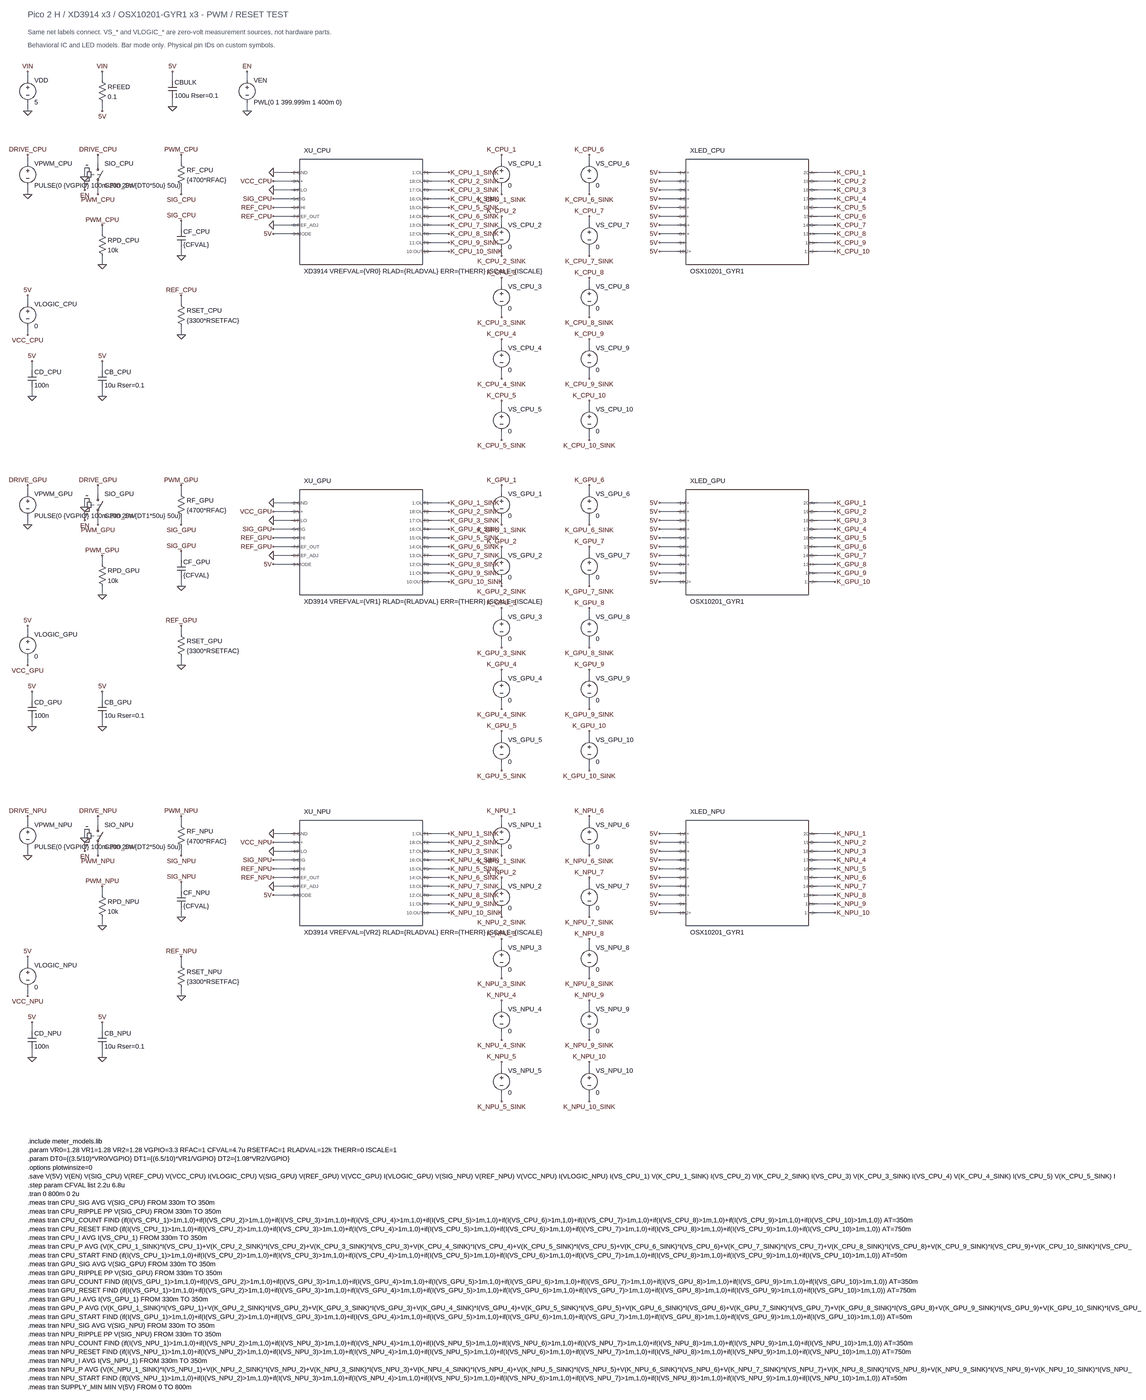
[diagram p0: schematic level_meter.asc, whole sheet]
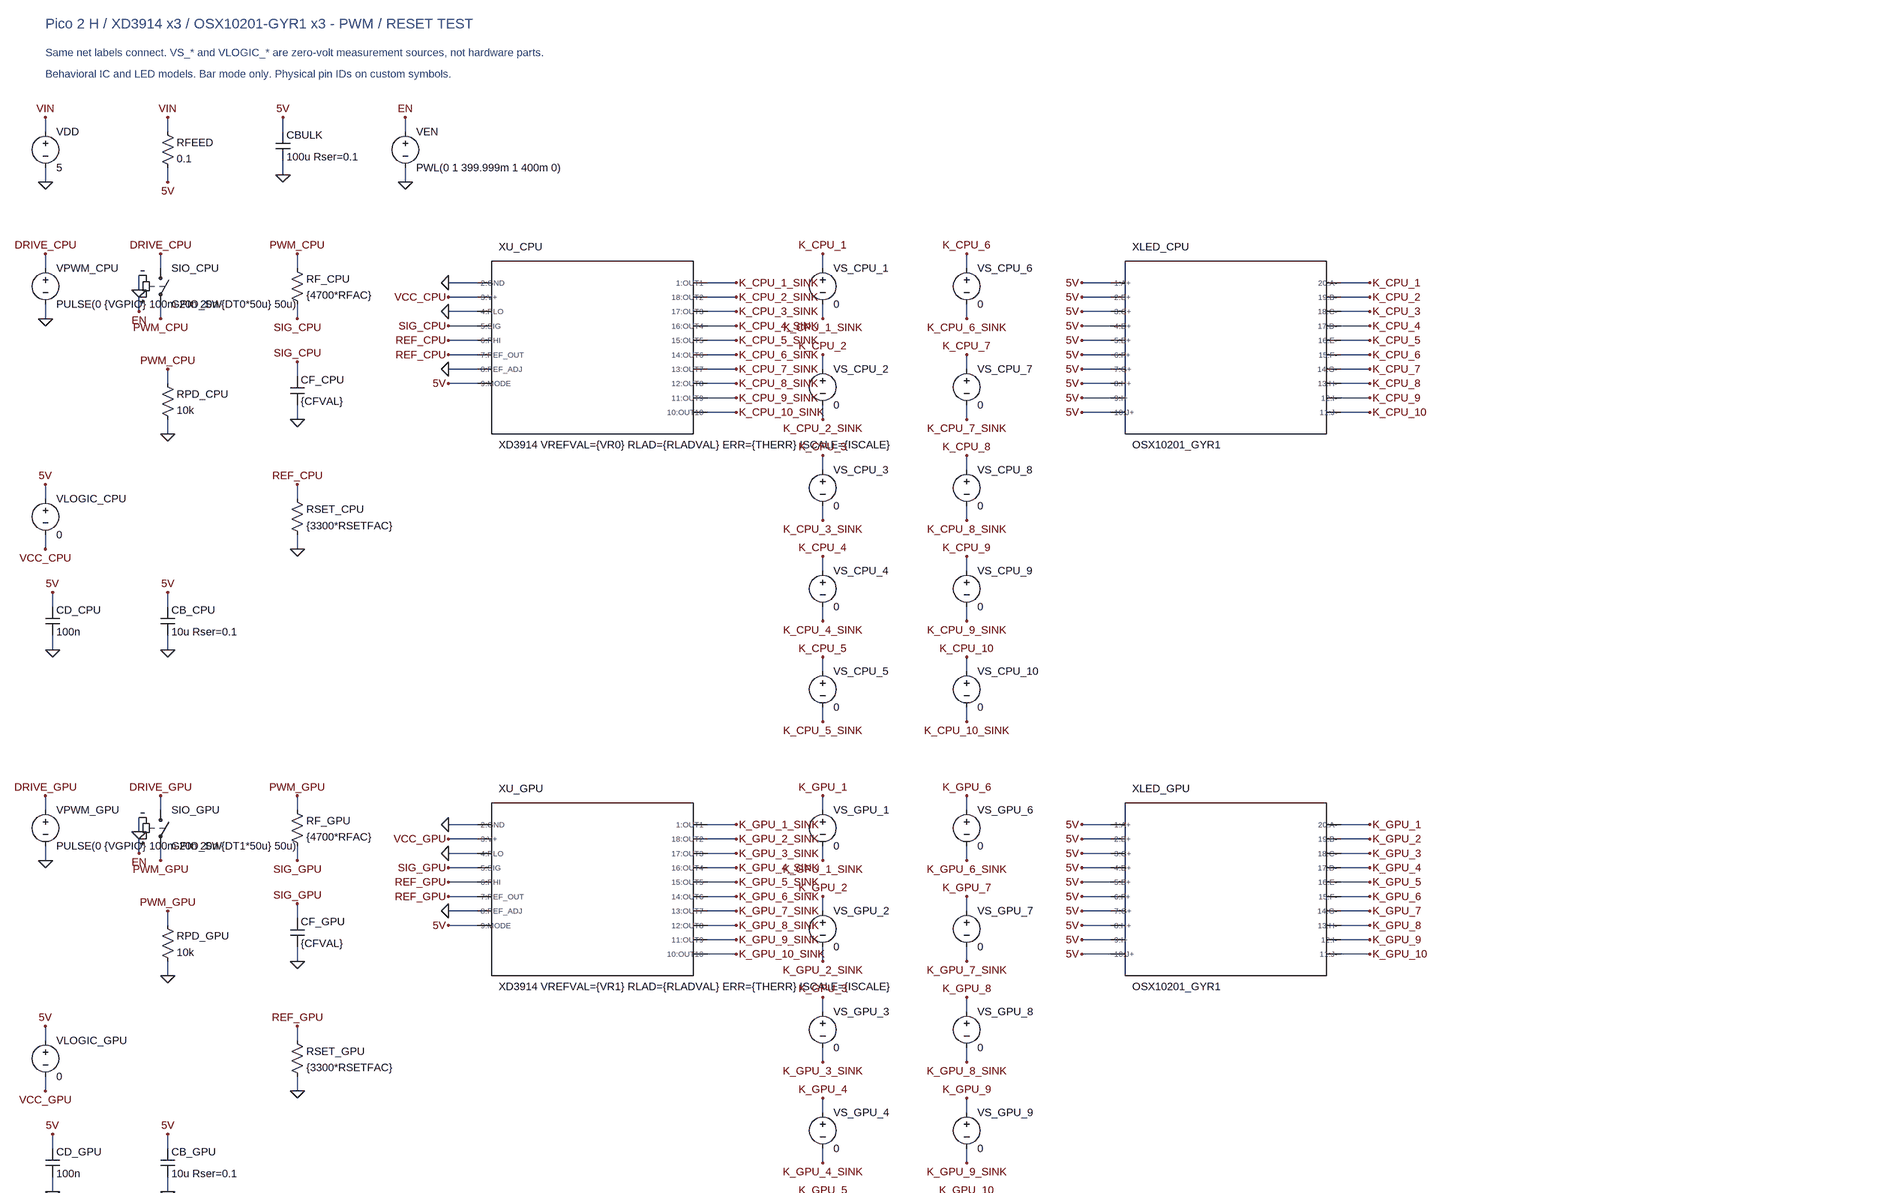
[diagram p1: schematic level_meter.asc, part, row 1 of 2, column 1 of 1]
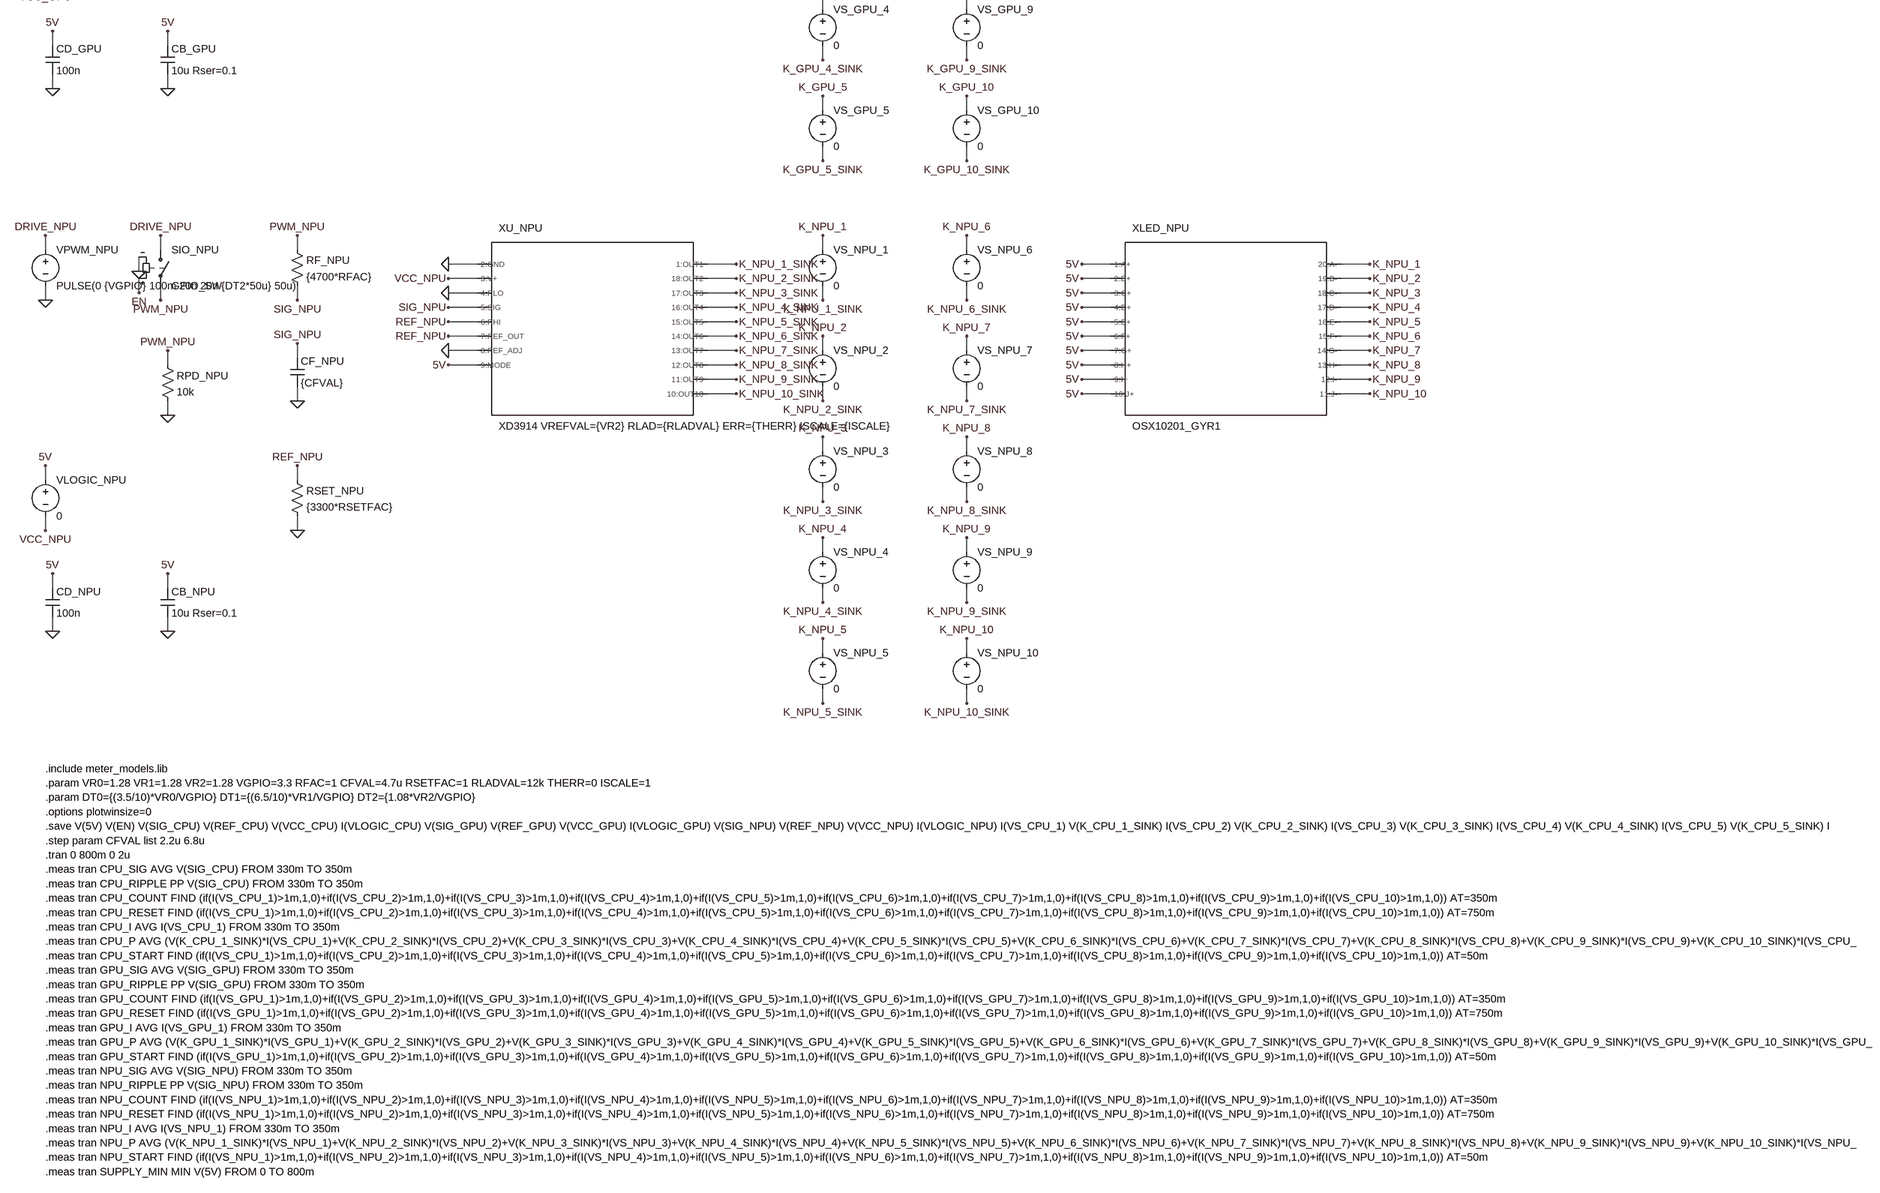
[diagram p2: schematic level_meter.asc, part, row 2 of 2, column 1 of 1]
level_meter.asc, the LTspice schematic file:
Version 4.1
SHEET 1 3500 7000
TEXT 64 -96 Left 3 ;Pico 2 H / XD3914 x3 / OSX10201-GYR1 x3 - PWM / RESET TEST
TEXT 64 -32 Left 2 ;Same net labels connect. VS_* and VLOGIC_* are zero-volt measurement sources, not hardware parts.
TEXT 64 16 Left 2 ;Behavioral IC and LED models. Bar mode only. Physical pin IDs on custom symbols.
WIRE 64 144 64 112
FLAG 64 112 VIN
WIRE 64 224 64 256
FLAG 64 256 0
WIRE 336 144 336 112
FLAG 336 112 VIN
WIRE 336 224 336 256
FLAG 336 256 5V
WIRE 592 144 592 112
FLAG 592 112 5V
WIRE 592 208 592 240
FLAG 592 240 0
WIRE 64 656 64 624
FLAG 64 624 DRIVE_CPU
WIRE 64 736 64 768
FLAG 64 768 0
WIRE 320 656 320 624
FLAG 320 624 DRIVE_CPU
WIRE 320 736 320 768
FLAG 320 768 PWM_CPU
WIRE 272 720 272 752
FLAG 272 752 EN
WIRE 272 672 272 704
FLAG 272 704 0
WIRE 336 912 336 880
FLAG 336 880 PWM_CPU
WIRE 336 992 336 1024
FLAG 336 1024 0
WIRE 624 656 624 624
FLAG 624 624 PWM_CPU
WIRE 624 736 624 768
FLAG 624 768 SIG_CPU
WIRE 624 896 624 864
FLAG 624 864 SIG_CPU
WIRE 624 960 624 992
FLAG 624 992 0
WIRE 1536 688 1600 688
FLAG 1600 688 K_CPU_1_SINK
WIRE 1024 688 960 688
FLAG 960 688 0
WIRE 1024 720 960 720
FLAG 960 720 VCC_CPU
WIRE 1024 752 960 752
FLAG 960 752 0
WIRE 1024 784 960 784
FLAG 960 784 SIG_CPU
WIRE 1024 816 960 816
FLAG 960 816 REF_CPU
WIRE 1024 848 960 848
FLAG 960 848 REF_CPU
WIRE 1024 880 960 880
FLAG 960 880 0
WIRE 1024 912 960 912
FLAG 960 912 5V
WIRE 1536 976 1600 976
FLAG 1600 976 K_CPU_10_SINK
WIRE 1536 944 1600 944
FLAG 1600 944 K_CPU_9_SINK
WIRE 1536 912 1600 912
FLAG 1600 912 K_CPU_8_SINK
WIRE 1536 880 1600 880
FLAG 1600 880 K_CPU_7_SINK
WIRE 1536 848 1600 848
FLAG 1600 848 K_CPU_6_SINK
WIRE 1536 816 1600 816
FLAG 1600 816 K_CPU_5_SINK
WIRE 1536 784 1600 784
FLAG 1600 784 K_CPU_4_SINK
WIRE 1536 752 1600 752
FLAG 1600 752 K_CPU_3_SINK
WIRE 1536 720 1600 720
FLAG 1600 720 K_CPU_2_SINK
WIRE 64 1168 64 1136
FLAG 64 1136 5V
WIRE 64 1248 64 1280
FLAG 64 1280 VCC_CPU
WIRE 624 1168 624 1136
FLAG 624 1136 REF_CPU
WIRE 624 1248 624 1280
FLAG 624 1280 0
WIRE 80 1408 80 1376
FLAG 80 1376 5V
WIRE 80 1472 80 1504
FLAG 80 1504 0
WIRE 336 1408 336 1376
FLAG 336 1376 5V
WIRE 336 1472 336 1504
FLAG 336 1504 0
WIRE 2432 688 2368 688
FLAG 2368 688 5V
WIRE 2432 720 2368 720
FLAG 2368 720 5V
WIRE 2432 752 2368 752
FLAG 2368 752 5V
WIRE 2432 784 2368 784
FLAG 2368 784 5V
WIRE 2432 816 2368 816
FLAG 2368 816 5V
WIRE 2432 848 2368 848
FLAG 2368 848 5V
WIRE 2432 880 2368 880
FLAG 2368 880 5V
WIRE 2432 912 2368 912
FLAG 2368 912 5V
WIRE 2432 944 2368 944
FLAG 2368 944 5V
WIRE 2432 976 2368 976
FLAG 2368 976 5V
WIRE 2944 976 3008 976
FLAG 3008 976 K_CPU_10
WIRE 2944 944 3008 944
FLAG 3008 944 K_CPU_9
WIRE 2944 912 3008 912
FLAG 3008 912 K_CPU_8
WIRE 2944 880 3008 880
FLAG 3008 880 K_CPU_7
WIRE 2944 848 3008 848
FLAG 3008 848 K_CPU_6
WIRE 2944 816 3008 816
FLAG 3008 816 K_CPU_5
WIRE 2944 784 3008 784
FLAG 3008 784 K_CPU_4
WIRE 2944 752 3008 752
FLAG 3008 752 K_CPU_3
WIRE 2944 720 3008 720
FLAG 3008 720 K_CPU_2
WIRE 2944 688 3008 688
FLAG 3008 688 K_CPU_1
WIRE 1792 656 1792 624
FLAG 1792 624 K_CPU_1
WIRE 1792 736 1792 768
FLAG 1792 768 K_CPU_1_SINK
WIRE 1792 880 1792 848
FLAG 1792 848 K_CPU_2
WIRE 1792 960 1792 992
FLAG 1792 992 K_CPU_2_SINK
WIRE 1792 1104 1792 1072
FLAG 1792 1072 K_CPU_3
WIRE 1792 1184 1792 1216
FLAG 1792 1216 K_CPU_3_SINK
WIRE 1792 1328 1792 1296
FLAG 1792 1296 K_CPU_4
WIRE 1792 1408 1792 1440
FLAG 1792 1440 K_CPU_4_SINK
WIRE 1792 1552 1792 1520
FLAG 1792 1520 K_CPU_5
WIRE 1792 1632 1792 1664
FLAG 1792 1664 K_CPU_5_SINK
WIRE 2112 656 2112 624
FLAG 2112 624 K_CPU_6
WIRE 2112 736 2112 768
FLAG 2112 768 K_CPU_6_SINK
WIRE 2112 880 2112 848
FLAG 2112 848 K_CPU_7
WIRE 2112 960 2112 992
FLAG 2112 992 K_CPU_7_SINK
WIRE 2112 1104 2112 1072
FLAG 2112 1072 K_CPU_8
WIRE 2112 1184 2112 1216
FLAG 2112 1216 K_CPU_8_SINK
WIRE 2112 1328 2112 1296
FLAG 2112 1296 K_CPU_9
WIRE 2112 1408 2112 1440
FLAG 2112 1440 K_CPU_9_SINK
WIRE 2112 1552 2112 1520
FLAG 2112 1520 K_CPU_10
WIRE 2112 1632 2112 1664
FLAG 2112 1664 K_CPU_10_SINK
WIRE 64 2192 64 2160
FLAG 64 2160 DRIVE_GPU
WIRE 64 2272 64 2304
FLAG 64 2304 0
WIRE 320 2192 320 2160
FLAG 320 2160 DRIVE_GPU
WIRE 320 2272 320 2304
FLAG 320 2304 PWM_GPU
WIRE 272 2256 272 2288
FLAG 272 2288 EN
WIRE 272 2208 272 2240
FLAG 272 2240 0
WIRE 336 2448 336 2416
FLAG 336 2416 PWM_GPU
WIRE 336 2528 336 2560
FLAG 336 2560 0
WIRE 624 2192 624 2160
FLAG 624 2160 PWM_GPU
WIRE 624 2272 624 2304
FLAG 624 2304 SIG_GPU
WIRE 624 2432 624 2400
FLAG 624 2400 SIG_GPU
WIRE 624 2496 624 2528
FLAG 624 2528 0
WIRE 1536 2224 1600 2224
FLAG 1600 2224 K_GPU_1_SINK
WIRE 1024 2224 960 2224
FLAG 960 2224 0
WIRE 1024 2256 960 2256
FLAG 960 2256 VCC_GPU
WIRE 1024 2288 960 2288
FLAG 960 2288 0
WIRE 1024 2320 960 2320
FLAG 960 2320 SIG_GPU
WIRE 1024 2352 960 2352
FLAG 960 2352 REF_GPU
WIRE 1024 2384 960 2384
FLAG 960 2384 REF_GPU
WIRE 1024 2416 960 2416
FLAG 960 2416 0
WIRE 1024 2448 960 2448
FLAG 960 2448 5V
WIRE 1536 2512 1600 2512
FLAG 1600 2512 K_GPU_10_SINK
WIRE 1536 2480 1600 2480
FLAG 1600 2480 K_GPU_9_SINK
WIRE 1536 2448 1600 2448
FLAG 1600 2448 K_GPU_8_SINK
WIRE 1536 2416 1600 2416
FLAG 1600 2416 K_GPU_7_SINK
WIRE 1536 2384 1600 2384
FLAG 1600 2384 K_GPU_6_SINK
WIRE 1536 2352 1600 2352
FLAG 1600 2352 K_GPU_5_SINK
WIRE 1536 2320 1600 2320
FLAG 1600 2320 K_GPU_4_SINK
WIRE 1536 2288 1600 2288
FLAG 1600 2288 K_GPU_3_SINK
WIRE 1536 2256 1600 2256
FLAG 1600 2256 K_GPU_2_SINK
WIRE 64 2704 64 2672
FLAG 64 2672 5V
WIRE 64 2784 64 2816
FLAG 64 2816 VCC_GPU
WIRE 624 2704 624 2672
FLAG 624 2672 REF_GPU
WIRE 624 2784 624 2816
FLAG 624 2816 0
WIRE 80 2944 80 2912
FLAG 80 2912 5V
WIRE 80 3008 80 3040
FLAG 80 3040 0
WIRE 336 2944 336 2912
FLAG 336 2912 5V
WIRE 336 3008 336 3040
FLAG 336 3040 0
WIRE 2432 2224 2368 2224
FLAG 2368 2224 5V
WIRE 2432 2256 2368 2256
FLAG 2368 2256 5V
WIRE 2432 2288 2368 2288
FLAG 2368 2288 5V
WIRE 2432 2320 2368 2320
FLAG 2368 2320 5V
WIRE 2432 2352 2368 2352
FLAG 2368 2352 5V
WIRE 2432 2384 2368 2384
FLAG 2368 2384 5V
WIRE 2432 2416 2368 2416
FLAG 2368 2416 5V
WIRE 2432 2448 2368 2448
FLAG 2368 2448 5V
WIRE 2432 2480 2368 2480
FLAG 2368 2480 5V
WIRE 2432 2512 2368 2512
FLAG 2368 2512 5V
WIRE 2944 2512 3008 2512
FLAG 3008 2512 K_GPU_10
WIRE 2944 2480 3008 2480
FLAG 3008 2480 K_GPU_9
WIRE 2944 2448 3008 2448
FLAG 3008 2448 K_GPU_8
WIRE 2944 2416 3008 2416
FLAG 3008 2416 K_GPU_7
WIRE 2944 2384 3008 2384
FLAG 3008 2384 K_GPU_6
WIRE 2944 2352 3008 2352
FLAG 3008 2352 K_GPU_5
WIRE 2944 2320 3008 2320
FLAG 3008 2320 K_GPU_4
WIRE 2944 2288 3008 2288
FLAG 3008 2288 K_GPU_3
WIRE 2944 2256 3008 2256
FLAG 3008 2256 K_GPU_2
WIRE 2944 2224 3008 2224
FLAG 3008 2224 K_GPU_1
WIRE 1792 2192 1792 2160
FLAG 1792 2160 K_GPU_1
WIRE 1792 2272 1792 2304
FLAG 1792 2304 K_GPU_1_SINK
WIRE 1792 2416 1792 2384
FLAG 1792 2384 K_GPU_2
WIRE 1792 2496 1792 2528
FLAG 1792 2528 K_GPU_2_SINK
WIRE 1792 2640 1792 2608
FLAG 1792 2608 K_GPU_3
WIRE 1792 2720 1792 2752
FLAG 1792 2752 K_GPU_3_SINK
WIRE 1792 2864 1792 2832
FLAG 1792 2832 K_GPU_4
WIRE 1792 2944 1792 2976
FLAG 1792 2976 K_GPU_4_SINK
WIRE 1792 3088 1792 3056
FLAG 1792 3056 K_GPU_5
WIRE 1792 3168 1792 3200
FLAG 1792 3200 K_GPU_5_SINK
WIRE 2112 2192 2112 2160
FLAG 2112 2160 K_GPU_6
WIRE 2112 2272 2112 2304
FLAG 2112 2304 K_GPU_6_SINK
WIRE 2112 2416 2112 2384
FLAG 2112 2384 K_GPU_7
WIRE 2112 2496 2112 2528
FLAG 2112 2528 K_GPU_7_SINK
WIRE 2112 2640 2112 2608
FLAG 2112 2608 K_GPU_8
WIRE 2112 2720 2112 2752
FLAG 2112 2752 K_GPU_8_SINK
WIRE 2112 2864 2112 2832
FLAG 2112 2832 K_GPU_9
WIRE 2112 2944 2112 2976
FLAG 2112 2976 K_GPU_9_SINK
WIRE 2112 3088 2112 3056
FLAG 2112 3056 K_GPU_10
WIRE 2112 3168 2112 3200
FLAG 2112 3200 K_GPU_10_SINK
WIRE 64 3728 64 3696
FLAG 64 3696 DRIVE_NPU
WIRE 64 3808 64 3840
FLAG 64 3840 0
WIRE 320 3728 320 3696
FLAG 320 3696 DRIVE_NPU
WIRE 320 3808 320 3840
FLAG 320 3840 PWM_NPU
WIRE 272 3792 272 3824
FLAG 272 3824 EN
WIRE 272 3744 272 3776
FLAG 272 3776 0
WIRE 336 3984 336 3952
FLAG 336 3952 PWM_NPU
WIRE 336 4064 336 4096
FLAG 336 4096 0
WIRE 624 3728 624 3696
FLAG 624 3696 PWM_NPU
WIRE 624 3808 624 3840
FLAG 624 3840 SIG_NPU
WIRE 624 3968 624 3936
FLAG 624 3936 SIG_NPU
WIRE 624 4032 624 4064
FLAG 624 4064 0
WIRE 1536 3760 1600 3760
FLAG 1600 3760 K_NPU_1_SINK
WIRE 1024 3760 960 3760
FLAG 960 3760 0
WIRE 1024 3792 960 3792
FLAG 960 3792 VCC_NPU
WIRE 1024 3824 960 3824
FLAG 960 3824 0
WIRE 1024 3856 960 3856
FLAG 960 3856 SIG_NPU
WIRE 1024 3888 960 3888
FLAG 960 3888 REF_NPU
WIRE 1024 3920 960 3920
FLAG 960 3920 REF_NPU
WIRE 1024 3952 960 3952
FLAG 960 3952 0
WIRE 1024 3984 960 3984
FLAG 960 3984 5V
WIRE 1536 4048 1600 4048
FLAG 1600 4048 K_NPU_10_SINK
WIRE 1536 4016 1600 4016
FLAG 1600 4016 K_NPU_9_SINK
WIRE 1536 3984 1600 3984
FLAG 1600 3984 K_NPU_8_SINK
WIRE 1536 3952 1600 3952
FLAG 1600 3952 K_NPU_7_SINK
WIRE 1536 3920 1600 3920
FLAG 1600 3920 K_NPU_6_SINK
WIRE 1536 3888 1600 3888
FLAG 1600 3888 K_NPU_5_SINK
WIRE 1536 3856 1600 3856
FLAG 1600 3856 K_NPU_4_SINK
WIRE 1536 3824 1600 3824
FLAG 1600 3824 K_NPU_3_SINK
WIRE 1536 3792 1600 3792
FLAG 1600 3792 K_NPU_2_SINK
WIRE 64 4240 64 4208
FLAG 64 4208 5V
WIRE 64 4320 64 4352
FLAG 64 4352 VCC_NPU
WIRE 624 4240 624 4208
FLAG 624 4208 REF_NPU
WIRE 624 4320 624 4352
FLAG 624 4352 0
WIRE 80 4480 80 4448
FLAG 80 4448 5V
WIRE 80 4544 80 4576
FLAG 80 4576 0
WIRE 336 4480 336 4448
FLAG 336 4448 5V
WIRE 336 4544 336 4576
FLAG 336 4576 0
WIRE 2432 3760 2368 3760
FLAG 2368 3760 5V
WIRE 2432 3792 2368 3792
FLAG 2368 3792 5V
WIRE 2432 3824 2368 3824
FLAG 2368 3824 5V
WIRE 2432 3856 2368 3856
FLAG 2368 3856 5V
WIRE 2432 3888 2368 3888
FLAG 2368 3888 5V
WIRE 2432 3920 2368 3920
FLAG 2368 3920 5V
WIRE 2432 3952 2368 3952
FLAG 2368 3952 5V
WIRE 2432 3984 2368 3984
FLAG 2368 3984 5V
WIRE 2432 4016 2368 4016
FLAG 2368 4016 5V
WIRE 2432 4048 2368 4048
FLAG 2368 4048 5V
WIRE 2944 4048 3008 4048
FLAG 3008 4048 K_NPU_10
WIRE 2944 4016 3008 4016
FLAG 3008 4016 K_NPU_9
WIRE 2944 3984 3008 3984
FLAG 3008 3984 K_NPU_8
WIRE 2944 3952 3008 3952
FLAG 3008 3952 K_NPU_7
WIRE 2944 3920 3008 3920
FLAG 3008 3920 K_NPU_6
WIRE 2944 3888 3008 3888
FLAG 3008 3888 K_NPU_5
WIRE 2944 3856 3008 3856
FLAG 3008 3856 K_NPU_4
WIRE 2944 3824 3008 3824
FLAG 3008 3824 K_NPU_3
WIRE 2944 3792 3008 3792
FLAG 3008 3792 K_NPU_2
WIRE 2944 3760 3008 3760
FLAG 3008 3760 K_NPU_1
WIRE 1792 3728 1792 3696
FLAG 1792 3696 K_NPU_1
WIRE 1792 3808 1792 3840
FLAG 1792 3840 K_NPU_1_SINK
WIRE 1792 3952 1792 3920
FLAG 1792 3920 K_NPU_2
WIRE 1792 4032 1792 4064
FLAG 1792 4064 K_NPU_2_SINK
WIRE 1792 4176 1792 4144
FLAG 1792 4144 K_NPU_3
WIRE 1792 4256 1792 4288
FLAG 1792 4288 K_NPU_3_SINK
WIRE 1792 4400 1792 4368
FLAG 1792 4368 K_NPU_4
WIRE 1792 4480 1792 4512
FLAG 1792 4512 K_NPU_4_SINK
WIRE 1792 4624 1792 4592
FLAG 1792 4592 K_NPU_5
WIRE 1792 4704 1792 4736
FLAG 1792 4736 K_NPU_5_SINK
WIRE 2112 3728 2112 3696
FLAG 2112 3696 K_NPU_6
WIRE 2112 3808 2112 3840
FLAG 2112 3840 K_NPU_6_SINK
WIRE 2112 3952 2112 3920
FLAG 2112 3920 K_NPU_7
WIRE 2112 4032 2112 4064
FLAG 2112 4064 K_NPU_7_SINK
WIRE 2112 4176 2112 4144
FLAG 2112 4144 K_NPU_8
WIRE 2112 4256 2112 4288
FLAG 2112 4288 K_NPU_8_SINK
WIRE 2112 4400 2112 4368
FLAG 2112 4368 K_NPU_9
WIRE 2112 4480 2112 4512
FLAG 2112 4512 K_NPU_9_SINK
WIRE 2112 4624 2112 4592
FLAG 2112 4592 K_NPU_10
WIRE 2112 4704 2112 4736
FLAG 2112 4736 K_NPU_10_SINK
WIRE 864 144 864 112
FLAG 864 112 EN
WIRE 864 224 864 256
FLAG 864 256 0
SYMBOL voltage 64 128 R0
SYMATTR InstName VDD
SYMATTR Value 5
SYMBOL res 320 128 R0
SYMATTR InstName RFEED
SYMATTR Value 0.1
SYMBOL cap 576 144 R0
SYMATTR InstName CBULK
SYMATTR Value 100u Rser=0.1
SYMBOL voltage 64 640 R0
SYMATTR InstName VPWM_CPU
SYMATTR Value PULSE(0 {VGPIO} 100m 20n 20n {DT0*50u} 50u)
SYMBOL sw 320 640 R0
SYMATTR InstName SIO_CPU
SYMATTR Value GPIO_SW
SYMBOL res 320 896 R0
SYMATTR InstName RPD_CPU
SYMATTR Value 10k
SYMBOL res 608 640 R0
SYMATTR InstName RF_CPU
SYMATTR Value {4700*RFAC}
SYMBOL cap 608 896 R0
SYMATTR InstName CF_CPU
SYMATTR Value {CFVAL}
SYMBOL XD3914 1024 640 R0
SYMATTR InstName XU_CPU
SYMATTR Value XD3914 VREFVAL={VR0} RLAD={RLADVAL} ERR={THERR} ISCALE={ISCALE}
SYMBOL voltage 64 1152 R0
SYMATTR InstName VLOGIC_CPU
SYMATTR Value 0
SYMBOL res 608 1152 R0
SYMATTR InstName RSET_CPU
SYMATTR Value {3300*RSETFAC}
SYMBOL cap 64 1408 R0
SYMATTR InstName CD_CPU
SYMATTR Value 100n
SYMBOL cap 320 1408 R0
SYMATTR InstName CB_CPU
SYMATTR Value 10u Rser=0.1
SYMBOL OSX10201_GYR1 2432 640 R0
SYMATTR InstName XLED_CPU
SYMATTR Value OSX10201_GYR1
SYMBOL voltage 1792 640 R0
SYMATTR InstName VS_CPU_1
SYMATTR Value 0
SYMBOL voltage 1792 864 R0
SYMATTR InstName VS_CPU_2
SYMATTR Value 0
SYMBOL voltage 1792 1088 R0
SYMATTR InstName VS_CPU_3
SYMATTR Value 0
SYMBOL voltage 1792 1312 R0
SYMATTR InstName VS_CPU_4
SYMATTR Value 0
SYMBOL voltage 1792 1536 R0
SYMATTR InstName VS_CPU_5
SYMATTR Value 0
SYMBOL voltage 2112 640 R0
SYMATTR InstName VS_CPU_6
SYMATTR Value 0
SYMBOL voltage 2112 864 R0
SYMATTR InstName VS_CPU_7
SYMATTR Value 0
SYMBOL voltage 2112 1088 R0
SYMATTR InstName VS_CPU_8
SYMATTR Value 0
SYMBOL voltage 2112 1312 R0
SYMATTR InstName VS_CPU_9
SYMATTR Value 0
SYMBOL voltage 2112 1536 R0
SYMATTR InstName VS_CPU_10
SYMATTR Value 0
SYMBOL voltage 64 2176 R0
SYMATTR InstName VPWM_GPU
SYMATTR Value PULSE(0 {VGPIO} 100m 20n 20n {DT1*50u} 50u)
SYMBOL sw 320 2176 R0
SYMATTR InstName SIO_GPU
SYMATTR Value GPIO_SW
SYMBOL res 320 2432 R0
SYMATTR InstName RPD_GPU
SYMATTR Value 10k
SYMBOL res 608 2176 R0
SYMATTR InstName RF_GPU
SYMATTR Value {4700*RFAC}
SYMBOL cap 608 2432 R0
SYMATTR InstName CF_GPU
SYMATTR Value {CFVAL}
SYMBOL XD3914 1024 2176 R0
SYMATTR InstName XU_GPU
SYMATTR Value XD3914 VREFVAL={VR1} RLAD={RLADVAL} ERR={THERR} ISCALE={ISCALE}
SYMBOL voltage 64 2688 R0
SYMATTR InstName VLOGIC_GPU
SYMATTR Value 0
SYMBOL res 608 2688 R0
SYMATTR InstName RSET_GPU
SYMATTR Value {3300*RSETFAC}
SYMBOL cap 64 2944 R0
SYMATTR InstName CD_GPU
SYMATTR Value 100n
SYMBOL cap 320 2944 R0
SYMATTR InstName CB_GPU
SYMATTR Value 10u Rser=0.1
SYMBOL OSX10201_GYR1 2432 2176 R0
SYMATTR InstName XLED_GPU
SYMATTR Value OSX10201_GYR1
SYMBOL voltage 1792 2176 R0
SYMATTR InstName VS_GPU_1
SYMATTR Value 0
SYMBOL voltage 1792 2400 R0
SYMATTR InstName VS_GPU_2
SYMATTR Value 0
SYMBOL voltage 1792 2624 R0
SYMATTR InstName VS_GPU_3
SYMATTR Value 0
SYMBOL voltage 1792 2848 R0
SYMATTR InstName VS_GPU_4
SYMATTR Value 0
SYMBOL voltage 1792 3072 R0
SYMATTR InstName VS_GPU_5
SYMATTR Value 0
SYMBOL voltage 2112 2176 R0
SYMATTR InstName VS_GPU_6
SYMATTR Value 0
SYMBOL voltage 2112 2400 R0
SYMATTR InstName VS_GPU_7
SYMATTR Value 0
SYMBOL voltage 2112 2624 R0
SYMATTR InstName VS_GPU_8
SYMATTR Value 0
SYMBOL voltage 2112 2848 R0
SYMATTR InstName VS_GPU_9
SYMATTR Value 0
SYMBOL voltage 2112 3072 R0
SYMATTR InstName VS_GPU_10
SYMATTR Value 0
SYMBOL voltage 64 3712 R0
SYMATTR InstName VPWM_NPU
SYMATTR Value PULSE(0 {VGPIO} 100m 20n 20n {DT2*50u} 50u)
SYMBOL sw 320 3712 R0
SYMATTR InstName SIO_NPU
SYMATTR Value GPIO_SW
SYMBOL res 320 3968 R0
SYMATTR InstName RPD_NPU
SYMATTR Value 10k
SYMBOL res 608 3712 R0
SYMATTR InstName RF_NPU
SYMATTR Value {4700*RFAC}
SYMBOL cap 608 3968 R0
SYMATTR InstName CF_NPU
SYMATTR Value {CFVAL}
SYMBOL XD3914 1024 3712 R0
SYMATTR InstName XU_NPU
SYMATTR Value XD3914 VREFVAL={VR2} RLAD={RLADVAL} ERR={THERR} ISCALE={ISCALE}
SYMBOL voltage 64 4224 R0
SYMATTR InstName VLOGIC_NPU
SYMATTR Value 0
SYMBOL res 608 4224 R0
SYMATTR InstName RSET_NPU
SYMATTR Value {3300*RSETFAC}
SYMBOL cap 64 4480 R0
SYMATTR InstName CD_NPU
SYMATTR Value 100n
SYMBOL cap 320 4480 R0
SYMATTR InstName CB_NPU
SYMATTR Value 10u Rser=0.1
SYMBOL OSX10201_GYR1 2432 3712 R0
SYMATTR InstName XLED_NPU
SYMATTR Value OSX10201_GYR1
SYMBOL voltage 1792 3712 R0
SYMATTR InstName VS_NPU_1
SYMATTR Value 0
SYMBOL voltage 1792 3936 R0
SYMATTR InstName VS_NPU_2
SYMATTR Value 0
SYMBOL voltage 1792 4160 R0
SYMATTR InstName VS_NPU_3
SYMATTR Value 0
SYMBOL voltage 1792 4384 R0
SYMATTR InstName VS_NPU_4
SYMATTR Value 0
SYMBOL voltage 1792 4608 R0
SYMATTR InstName VS_NPU_5
SYMATTR Value 0
SYMBOL voltage 2112 3712 R0
SYMATTR InstName VS_NPU_6
SYMATTR Value 0
SYMBOL voltage 2112 3936 R0
SYMATTR InstName VS_NPU_7
SYMATTR Value 0
SYMBOL voltage 2112 4160 R0
SYMATTR InstName VS_NPU_8
SYMATTR Value 0
SYMBOL voltage 2112 4384 R0
SYMATTR InstName VS_NPU_9
SYMATTR Value 0
SYMBOL voltage 2112 4608 R0
SYMATTR InstName VS_NPU_10
SYMATTR Value 0
SYMBOL voltage 864 128 R0
SYMATTR InstName VEN
SYMATTR Value PWL(0 1 399.999m 1 400m 0)
TEXT 64 5408 Left 2 !.include meter_models.lib
TEXT 64 5440 Left 2 !.param VR0=1.28 VR1=1.28 VR2=1.28 VGPIO=3.3 RFAC=1 CFVAL=4.7u RSETFAC=1 RLADVAL=12k THERR=0 ISCALE=1
TEXT 64 5472 Left 2 !.param DT0={(3.5/10)*VR0/VGPIO} DT1={(6.5/10)*VR1/VGPIO} DT2={1.08*VR2/VGPIO}
TEXT 64 5504 Left 2 !.options plotwinsize=0
TEXT 64 5536 Left 2 !.save V(5V) V(EN) V(SIG_CPU) V(REF_CPU) V(VCC_CPU) I(VLOGIC_CPU) V(SIG_GPU) V(REF_GPU) V(VCC_GPU) I(VLOGIC_GPU) V(SIG_NPU) V(REF_NPU) V(VCC_NPU) I(VLOGIC_NPU) I(VS_CPU_1) V(K_CPU_1_SINK) I(VS_CPU_2) V(K_CPU_2_SINK) I(VS_CPU_3) V(K_CPU_3_SINK) I(VS_CPU_4) V(K_CPU_4_SINK) I(VS_CPU_5) V(K_CPU_5_SINK) I(VS_CPU_6) V(K_CPU_6_SINK) I(VS_CPU_7) V(K_CPU_7_SINK) I(VS_CPU_8) V(K_CPU_8_SINK) I(VS_CPU_9) V(K_CPU_9_SINK) I(VS_CPU_10) V(K_CPU_10_SINK) I(VS_GPU_1) V(K_GPU_1_SINK) I(VS_GPU_2) V(K_GPU_2_SINK) I(VS_GPU_3) V(K_GPU_3_SINK) I(VS_GPU_4) V(K_GPU_4_SINK) I(VS_GPU_5) V(K_GPU_5_SINK) I(VS_GPU_6) V(K_GPU_6_SINK) I(VS_GPU_7) V(K_GPU_7_SINK) I(VS_GPU_8) V(K_GPU_8_SINK) I(VS_GPU_9) V(K_GPU_9_SINK) I(VS_GPU_10) V(K_GPU_10_SINK) I(VS_NPU_1) V(K_NPU_1_SINK) I(VS_NPU_2) V(K_NPU_2_SINK) I(VS_NPU_3) V(K_NPU_3_SINK) I(VS_NPU_4) V(K_NPU_4_SINK) I(VS_NPU_5) V(K_NPU_5_SINK) I(VS_NPU_6) V(K_NPU_6_SINK) I(VS_NPU_7) V(K_NPU_7_SINK) I(VS_NPU_8) V(K_NPU_8_SINK) I(VS_NPU_9) V(K_NPU_9_SINK) I(VS_NPU_10) V(K_NPU_10_SINK) I(VDD)
TEXT 64 5568 Left 2 !.step param CFVAL list 2.2u 6.8u
TEXT 64 5600 Left 2 !.tran 0 800m 0 2u
TEXT 64 5632 Left 2 !.meas tran CPU_SIG AVG V(SIG_CPU) FROM 330m TO 350m
TEXT 64 5664 Left 2 !.meas tran CPU_RIPPLE PP V(SIG_CPU) FROM 330m TO 350m
TEXT 64 5696 Left 2 !.meas tran CPU_COUNT FIND (if(I(VS_CPU_1)>1m,1,0)+if(I(VS_CPU_2)>1m,1,0)+if(I(VS_CPU_3)>1m,1,0)+if(I(VS_CPU_4)>1m,1,0)+if(I(VS_CPU_5)>1m,1,0)+if(I(VS_CPU_6)>1m,1,0)+if(I(VS_CPU_7)>1m,1,0)+if(I(VS_CPU_8)>1m,1,0)+if(I(VS_CPU_9)>1m,1,0)+if(I(VS_CPU_10)>1m,1,0)) AT=350m
TEXT 64 5728 Left 2 !.meas tran CPU_RESET FIND (if(I(VS_CPU_1)>1m,1,0)+if(I(VS_CPU_2)>1m,1,0)+if(I(VS_CPU_3)>1m,1,0)+if(I(VS_CPU_4)>1m,1,0)+if(I(VS_CPU_5)>1m,1,0)+if(I(VS_CPU_6)>1m,1,0)+if(I(VS_CPU_7)>1m,1,0)+if(I(VS_CPU_8)>1m,1,0)+if(I(VS_CPU_9)>1m,1,0)+if(I(VS_CPU_10)>1m,1,0)) AT=750m
TEXT 64 5760 Left 2 !.meas tran CPU_I AVG I(VS_CPU_1) FROM 330m TO 350m
TEXT 64 5792 Left 2 !.meas tran CPU_P AVG (V(K_CPU_1_SINK)*I(VS_CPU_1)+V(K_CPU_2_SINK)*I(VS_CPU_2)+V(K_CPU_3_SINK)*I(VS_CPU_3)+V(K_CPU_4_SINK)*I(VS_CPU_4)+V(K_CPU_5_SINK)*I(VS_CPU_5)+V(K_CPU_6_SINK)*I(VS_CPU_6)+V(K_CPU_7_SINK)*I(VS_CPU_7)+V(K_CPU_8_SINK)*I(VS_CPU_8)+V(K_CPU_9_SINK)*I(VS_CPU_9)+V(K_CPU_10_SINK)*I(VS_CPU_10)+V(VCC_CPU)*I(VLOGIC_CPU)) FROM 330m TO 350m
TEXT 64 5824 Left 2 !.meas tran CPU_START FIND (if(I(VS_CPU_1)>1m,1,0)+if(I(VS_CPU_2)>1m,1,0)+if(I(VS_CPU_3)>1m,1,0)+if(I(VS_CPU_4)>1m,1,0)+if(I(VS_CPU_5)>1m,1,0)+if(I(VS_CPU_6)>1m,1,0)+if(I(VS_CPU_7)>1m,1,0)+if(I(VS_CPU_8)>1m,1,0)+if(I(VS_CPU_9)>1m,1,0)+if(I(VS_CPU_10)>1m,1,0)) AT=50m
TEXT 64 5856 Left 2 !.meas tran GPU_SIG AVG V(SIG_GPU) FROM 330m TO 350m
TEXT 64 5888 Left 2 !.meas tran GPU_RIPPLE PP V(SIG_GPU) FROM 330m TO 350m
TEXT 64 5920 Left 2 !.meas tran GPU_COUNT FIND (if(I(VS_GPU_1)>1m,1,0)+if(I(VS_GPU_2)>1m,1,0)+if(I(VS_GPU_3)>1m,1,0)+if(I(VS_GPU_4)>1m,1,0)+if(I(VS_GPU_5)>1m,1,0)+if(I(VS_GPU_6)>1m,1,0)+if(I(VS_GPU_7)>1m,1,0)+if(I(VS_GPU_8)>1m,1,0)+if(I(VS_GPU_9)>1m,1,0)+if(I(VS_GPU_10)>1m,1,0)) AT=350m
TEXT 64 5952 Left 2 !.meas tran GPU_RESET FIND (if(I(VS_GPU_1)>1m,1,0)+if(I(VS_GPU_2)>1m,1,0)+if(I(VS_GPU_3)>1m,1,0)+if(I(VS_GPU_4)>1m,1,0)+if(I(VS_GPU_5)>1m,1,0)+if(I(VS_GPU_6)>1m,1,0)+if(I(VS_GPU_7)>1m,1,0)+if(I(VS_GPU_8)>1m,1,0)+if(I(VS_GPU_9)>1m,1,0)+if(I(VS_GPU_10)>1m,1,0)) AT=750m
TEXT 64 5984 Left 2 !.meas tran GPU_I AVG I(VS_GPU_1) FROM 330m TO 350m
TEXT 64 6016 Left 2 !.meas tran GPU_P AVG (V(K_GPU_1_SINK)*I(VS_GPU_1)+V(K_GPU_2_SINK)*I(VS_GPU_2)+V(K_GPU_3_SINK)*I(VS_GPU_3)+V(K_GPU_4_SINK)*I(VS_GPU_4)+V(K_GPU_5_SINK)*I(VS_GPU_5)+V(K_GPU_6_SINK)*I(VS_GPU_6)+V(K_GPU_7_SINK)*I(VS_GPU_7)+V(K_GPU_8_SINK)*I(VS_GPU_8)+V(K_GPU_9_SINK)*I(VS_GPU_9)+V(K_GPU_10_SINK)*I(VS_GPU_10)+V(VCC_GPU)*I(VLOGIC_GPU)) FROM 330m TO 350m
TEXT 64 6048 Left 2 !.meas tran GPU_START FIND (if(I(VS_GPU_1)>1m,1,0)+if(I(VS_GPU_2)>1m,1,0)+if(I(VS_GPU_3)>1m,1,0)+if(I(VS_GPU_4)>1m,1,0)+if(I(VS_GPU_5)>1m,1,0)+if(I(VS_GPU_6)>1m,1,0)+if(I(VS_GPU_7)>1m,1,0)+if(I(VS_GPU_8)>1m,1,0)+if(I(VS_GPU_9)>1m,1,0)+if(I(VS_GPU_10)>1m,1,0)) AT=50m
TEXT 64 6080 Left 2 !.meas tran NPU_SIG AVG V(SIG_NPU) FROM 330m TO 350m
TEXT 64 6112 Left 2 !.meas tran NPU_RIPPLE PP V(SIG_NPU) FROM 330m TO 350m
TEXT 64 6144 Left 2 !.meas tran NPU_COUNT FIND (if(I(VS_NPU_1)>1m,1,0)+if(I(VS_NPU_2)>1m,1,0)+if(I(VS_NPU_3)>1m,1,0)+if(I(VS_NPU_4)>1m,1,0)+if(I(VS_NPU_5)>1m,1,0)+if(I(VS_NPU_6)>1m,1,0)+if(I(VS_NPU_7)>1m,1,0)+if(I(VS_NPU_8)>1m,1,0)+if(I(VS_NPU_9)>1m,1,0)+if(I(VS_NPU_10)>1m,1,0)) AT=350m
TEXT 64 6176 Left 2 !.meas tran NPU_RESET FIND (if(I(VS_NPU_1)>1m,1,0)+if(I(VS_NPU_2)>1m,1,0)+if(I(VS_NPU_3)>1m,1,0)+if(I(VS_NPU_4)>1m,1,0)+if(I(VS_NPU_5)>1m,1,0)+if(I(VS_NPU_6)>1m,1,0)+if(I(VS_NPU_7)>1m,1,0)+if(I(VS_NPU_8)>1m,1,0)+if(I(VS_NPU_9)>1m,1,0)+if(I(VS_NPU_10)>1m,1,0)) AT=750m
TEXT 64 6208 Left 2 !.meas tran NPU_I AVG I(VS_NPU_1) FROM 330m TO 350m
TEXT 64 6240 Left 2 !.meas tran NPU_P AVG (V(K_NPU_1_SINK)*I(VS_NPU_1)+V(K_NPU_2_SINK)*I(VS_NPU_2)+V(K_NPU_3_SINK)*I(VS_NPU_3)+V(K_NPU_4_SINK)*I(VS_NPU_4)+V(K_NPU_5_SINK)*I(VS_NPU_5)+V(K_NPU_6_SINK)*I(VS_NPU_6)+V(K_NPU_7_SINK)*I(VS_NPU_7)+V(K_NPU_8_SINK)*I(VS_NPU_8)+V(K_NPU_9_SINK)*I(VS_NPU_9)+V(K_NPU_10_SINK)*I(VS_NPU_10)+V(VCC_NPU)*I(VLOGIC_NPU)) FROM 330m TO 350m
TEXT 64 6272 Left 2 !.meas tran NPU_START FIND (if(I(VS_NPU_1)>1m,1,0)+if(I(VS_NPU_2)>1m,1,0)+if(I(VS_NPU_3)>1m,1,0)+if(I(VS_NPU_4)>1m,1,0)+if(I(VS_NPU_5)>1m,1,0)+if(I(VS_NPU_6)>1m,1,0)+if(I(VS_NPU_7)>1m,1,0)+if(I(VS_NPU_8)>1m,1,0)+if(I(VS_NPU_9)>1m,1,0)+if(I(VS_NPU_10)>1m,1,0)) AT=50m
TEXT 64 6304 Left 2 !.meas tran SUPPLY_MIN MIN V(5V) FROM 0 TO 800m

The netlist it stands for:
* level_meter.asc
VDD VIN 0 5
RFEED VIN 5V 0.1
CBULK 5V 0 100u Rser=0.1
VPWM_CPU DRIVE_CPU 0 PULSE(0 {VGPIO} 100m 20n 20n {DT0*50u} 50u)
SIO_CPU DRIVE_CPU PWM_CPU EN 0 GPIO_SW
RPD_CPU PWM_CPU 0 10k
RF_CPU PWM_CPU SIG_CPU {4700*RFAC}
CF_CPU SIG_CPU 0 {CFVAL}
X§XU_CPU K_CPU_1_SINK 0 VCC_CPU 0 SIG_CPU REF_CPU REF_CPU 0 5V K_CPU_10_SINK K_CPU_9_SINK K_CPU_8_SINK K_CPU_7_SINK K_CPU_6_SINK K_CPU_5_SINK K_CPU_4_SINK K_CPU_3_SINK K_CPU_2_SINK XD3914 VREFVAL={VR0} RLAD={RLADVAL} ERR={THERR} ISCALE={ISCALE}  ; pins 1:OUT1 2:GND 3:V+ 4:RLO 5:SIG 6:RHI 7:REF_OUT 8:REF_ADJ 9:MODE 10:OUT10 11:OUT9 12:OUT8 13:OUT7 14:OUT6 15:OUT5 16:OUT4 17:OUT3 18:OUT2
VLOGIC_CPU 5V VCC_CPU 0
RSET_CPU REF_CPU 0 {3300*RSETFAC}
CD_CPU 5V 0 100n
CB_CPU 5V 0 10u Rser=0.1
X§XLED_CPU 5V 5V 5V 5V 5V 5V 5V 5V 5V 5V K_CPU_10 K_CPU_9 K_CPU_8 K_CPU_7 K_CPU_6 K_CPU_5 K_CPU_4 K_CPU_3 K_CPU_2 K_CPU_1 OSX10201_GYR1  ; pins 1:A+ 2:B+ 3:C+ 4:D+ 5:E+ 6:F+ 7:G+ 8:H+ 9:I+ 10:J+ 11:J- 12:I- 13:H- 14:G- 15:F- 16:E- 17:D- 18:C- 19:B- 20:A-
VS_CPU_1 K_CPU_1 K_CPU_1_SINK 0
VS_CPU_2 K_CPU_2 K_CPU_2_SINK 0
VS_CPU_3 K_CPU_3 K_CPU_3_SINK 0
VS_CPU_4 K_CPU_4 K_CPU_4_SINK 0
VS_CPU_5 K_CPU_5 K_CPU_5_SINK 0
VS_CPU_6 K_CPU_6 K_CPU_6_SINK 0
VS_CPU_7 K_CPU_7 K_CPU_7_SINK 0
VS_CPU_8 K_CPU_8 K_CPU_8_SINK 0
VS_CPU_9 K_CPU_9 K_CPU_9_SINK 0
VS_CPU_10 K_CPU_10 K_CPU_10_SINK 0
VPWM_GPU DRIVE_GPU 0 PULSE(0 {VGPIO} 100m 20n 20n {DT1*50u} 50u)
SIO_GPU DRIVE_GPU PWM_GPU EN 0 GPIO_SW
RPD_GPU PWM_GPU 0 10k
RF_GPU PWM_GPU SIG_GPU {4700*RFAC}
CF_GPU SIG_GPU 0 {CFVAL}
X§XU_GPU K_GPU_1_SINK 0 VCC_GPU 0 SIG_GPU REF_GPU REF_GPU 0 5V K_GPU_10_SINK K_GPU_9_SINK K_GPU_8_SINK K_GPU_7_SINK K_GPU_6_SINK K_GPU_5_SINK K_GPU_4_SINK K_GPU_3_SINK K_GPU_2_SINK XD3914 VREFVAL={VR1} RLAD={RLADVAL} ERR={THERR} ISCALE={ISCALE}  ; pins 1:OUT1 2:GND 3:V+ 4:RLO 5:SIG 6:RHI 7:REF_OUT 8:REF_ADJ 9:MODE 10:OUT10 11:OUT9 12:OUT8 13:OUT7 14:OUT6 15:OUT5 16:OUT4 17:OUT3 18:OUT2
VLOGIC_GPU 5V VCC_GPU 0
RSET_GPU REF_GPU 0 {3300*RSETFAC}
CD_GPU 5V 0 100n
CB_GPU 5V 0 10u Rser=0.1
X§XLED_GPU 5V 5V 5V 5V 5V 5V 5V 5V 5V 5V K_GPU_10 K_GPU_9 K_GPU_8 K_GPU_7 K_GPU_6 K_GPU_5 K_GPU_4 K_GPU_3 K_GPU_2 K_GPU_1 OSX10201_GYR1  ; pins 1:A+ 2:B+ 3:C+ 4:D+ 5:E+ 6:F+ 7:G+ 8:H+ 9:I+ 10:J+ 11:J- 12:I- 13:H- 14:G- 15:F- 16:E- 17:D- 18:C- 19:B- 20:A-
VS_GPU_1 K_GPU_1 K_GPU_1_SINK 0
VS_GPU_2 K_GPU_2 K_GPU_2_SINK 0
VS_GPU_3 K_GPU_3 K_GPU_3_SINK 0
VS_GPU_4 K_GPU_4 K_GPU_4_SINK 0
VS_GPU_5 K_GPU_5 K_GPU_5_SINK 0
VS_GPU_6 K_GPU_6 K_GPU_6_SINK 0
VS_GPU_7 K_GPU_7 K_GPU_7_SINK 0
VS_GPU_8 K_GPU_8 K_GPU_8_SINK 0
VS_GPU_9 K_GPU_9 K_GPU_9_SINK 0
VS_GPU_10 K_GPU_10 K_GPU_10_SINK 0
VPWM_NPU DRIVE_NPU 0 PULSE(0 {VGPIO} 100m 20n 20n {DT2*50u} 50u)
SIO_NPU DRIVE_NPU PWM_NPU EN 0 GPIO_SW
RPD_NPU PWM_NPU 0 10k
RF_NPU PWM_NPU SIG_NPU {4700*RFAC}
CF_NPU SIG_NPU 0 {CFVAL}
X§XU_NPU K_NPU_1_SINK 0 VCC_NPU 0 SIG_NPU REF_NPU REF_NPU 0 5V K_NPU_10_SINK K_NPU_9_SINK K_NPU_8_SINK K_NPU_7_SINK K_NPU_6_SINK K_NPU_5_SINK K_NPU_4_SINK K_NPU_3_SINK K_NPU_2_SINK XD3914 VREFVAL={VR2} RLAD={RLADVAL} ERR={THERR} ISCALE={ISCALE}  ; pins 1:OUT1 2:GND 3:V+ 4:RLO 5:SIG 6:RHI 7:REF_OUT 8:REF_ADJ 9:MODE 10:OUT10 11:OUT9 12:OUT8 13:OUT7 14:OUT6 15:OUT5 16:OUT4 17:OUT3 18:OUT2
VLOGIC_NPU 5V VCC_NPU 0
RSET_NPU REF_NPU 0 {3300*RSETFAC}
CD_NPU 5V 0 100n
CB_NPU 5V 0 10u Rser=0.1
X§XLED_NPU 5V 5V 5V 5V 5V 5V 5V 5V 5V 5V K_NPU_10 K_NPU_9 K_NPU_8 K_NPU_7 K_NPU_6 K_NPU_5 K_NPU_4 K_NPU_3 K_NPU_2 K_NPU_1 OSX10201_GYR1  ; pins 1:A+ 2:B+ 3:C+ 4:D+ 5:E+ 6:F+ 7:G+ 8:H+ 9:I+ 10:J+ 11:J- 12:I- 13:H- 14:G- 15:F- 16:E- 17:D- 18:C- 19:B- 20:A-
VS_NPU_1 K_NPU_1 K_NPU_1_SINK 0
VS_NPU_2 K_NPU_2 K_NPU_2_SINK 0
VS_NPU_3 K_NPU_3 K_NPU_3_SINK 0
VS_NPU_4 K_NPU_4 K_NPU_4_SINK 0
VS_NPU_5 K_NPU_5 K_NPU_5_SINK 0
VS_NPU_6 K_NPU_6 K_NPU_6_SINK 0
VS_NPU_7 K_NPU_7 K_NPU_7_SINK 0
VS_NPU_8 K_NPU_8 K_NPU_8_SINK 0
VS_NPU_9 K_NPU_9 K_NPU_9_SINK 0
VS_NPU_10 K_NPU_10 K_NPU_10_SINK 0
VEN EN 0 PWL(0 1 399.999m 1 400m 0)
* Pico 2 H / XD3914 x3 / OSX10201-GYR1 x3 - PWM / RESET TEST
* Same net labels connect. VS_* and VLOGIC_* are zero-volt measurement sources, not hardware parts.
* Behavioral IC and LED models. Bar mode only. Physical pin IDs on custom symbols.
.include meter_models.lib
.param VR0=1.28 VR1=1.28 VR2=1.28 VGPIO=3.3 RFAC=1 CFVAL=4.7u RSETFAC=1 RLADVAL=12k THERR=0 ISCALE=1
.param DT0={(3.5/10)*VR0/VGPIO} DT1={(6.5/10)*VR1/VGPIO} DT2={1.08*VR2/VGPIO}
.options plotwinsize=0
.save V(5V) V(EN) V(SIG_CPU) V(REF_CPU) V(VCC_CPU) I(VLOGIC_CPU) V(SIG_GPU) V(REF_GPU) V(VCC_GPU) I(VLOGIC_GPU) V(SIG_NPU) V(REF_NPU) V(VCC_NPU) I(VLOGIC_NPU) I(VS_CPU_1) V(K_CPU_1_SINK) I(VS_CPU_2) V(K_CPU_2_SINK) I(VS_CPU_3) V(K_CPU_3_SINK) I(VS_CPU_4) V(K_CPU_4_SINK) I(VS_CPU_5) V(K_CPU_5_SINK) I(VS_CPU_6) V(K_CPU_6_SINK) I(VS_CPU_7) V(K_CPU_7_SINK) I(VS_CPU_8) V(K_CPU_8_SINK) I(VS_CPU_9) V(K_CPU_9_SINK) I(VS_CPU_10) V(K_CPU_10_SINK) I(VS_GPU_1) V(K_GPU_1_SINK) I(VS_GPU_2) V(K_GPU_2_SINK) I(VS_GPU_3) V(K_GPU_3_SINK) I(VS_GPU_4) V(K_GPU_4_SINK) I(VS_GPU_5) V(K_GPU_5_SINK) I(VS_GPU_6) V(K_GPU_6_SINK) I(VS_GPU_7) V(K_GPU_7_SINK) I(VS_GPU_8) V(K_GPU_8_SINK) I(VS_GPU_9) V(K_GPU_9_SINK) I(VS_GPU_10) V(K_GPU_10_SINK) I(VS_NPU_1) V(K_NPU_1_SINK) I(VS_NPU_2) V(K_NPU_2_SINK) I(VS_NPU_3) V(K_NPU_3_SINK) I(VS_NPU_4) V(K_NPU_4_SINK) I(VS_NPU_5) V(K_NPU_5_SINK) I(VS_NPU_6) V(K_NPU_6_SINK) I(VS_NPU_7) V(K_NPU_7_SINK) I(VS_NPU_8) V(K_NPU_8_SINK) I(VS_NPU_9) V(K_NPU_9_SINK) I(VS_NPU_10) V(K_NPU_10_SINK) I(VDD)
.step param CFVAL list 2.2u 6.8u
.tran 0 800m 0 2u
.meas tran CPU_SIG AVG V(SIG_CPU) FROM 330m TO 350m
.meas tran CPU_RIPPLE PP V(SIG_CPU) FROM 330m TO 350m
.meas tran CPU_COUNT FIND (if(I(VS_CPU_1)>1m,1,0)+if(I(VS_CPU_2)>1m,1,0)+if(I(VS_CPU_3)>1m,1,0)+if(I(VS_CPU_4)>1m,1,0)+if(I(VS_CPU_5)>1m,1,0)+if(I(VS_CPU_6)>1m,1,0)+if(I(VS_CPU_7)>1m,1,0)+if(I(VS_CPU_8)>1m,1,0)+if(I(VS_CPU_9)>1m,1,0)+if(I(VS_CPU_10)>1m,1,0)) AT=350m
.meas tran CPU_RESET FIND (if(I(VS_CPU_1)>1m,1,0)+if(I(VS_CPU_2)>1m,1,0)+if(I(VS_CPU_3)>1m,1,0)+if(I(VS_CPU_4)>1m,1,0)+if(I(VS_CPU_5)>1m,1,0)+if(I(VS_CPU_6)>1m,1,0)+if(I(VS_CPU_7)>1m,1,0)+if(I(VS_CPU_8)>1m,1,0)+if(I(VS_CPU_9)>1m,1,0)+if(I(VS_CPU_10)>1m,1,0)) AT=750m
.meas tran CPU_I AVG I(VS_CPU_1) FROM 330m TO 350m
.meas tran CPU_P AVG (V(K_CPU_1_SINK)*I(VS_CPU_1)+V(K_CPU_2_SINK)*I(VS_CPU_2)+V(K_CPU_3_SINK)*I(VS_CPU_3)+V(K_CPU_4_SINK)*I(VS_CPU_4)+V(K_CPU_5_SINK)*I(VS_CPU_5)+V(K_CPU_6_SINK)*I(VS_CPU_6)+V(K_CPU_7_SINK)*I(VS_CPU_7)+V(K_CPU_8_SINK)*I(VS_CPU_8)+V(K_CPU_9_SINK)*I(VS_CPU_9)+V(K_CPU_10_SINK)*I(VS_CPU_10)+V(VCC_CPU)*I(VLOGIC_CPU)) FROM 330m TO 350m
.meas tran CPU_START FIND (if(I(VS_CPU_1)>1m,1,0)+if(I(VS_CPU_2)>1m,1,0)+if(I(VS_CPU_3)>1m,1,0)+if(I(VS_CPU_4)>1m,1,0)+if(I(VS_CPU_5)>1m,1,0)+if(I(VS_CPU_6)>1m,1,0)+if(I(VS_CPU_7)>1m,1,0)+if(I(VS_CPU_8)>1m,1,0)+if(I(VS_CPU_9)>1m,1,0)+if(I(VS_CPU_10)>1m,1,0)) AT=50m
.meas tran GPU_SIG AVG V(SIG_GPU) FROM 330m TO 350m
.meas tran GPU_RIPPLE PP V(SIG_GPU) FROM 330m TO 350m
.meas tran GPU_COUNT FIND (if(I(VS_GPU_1)>1m,1,0)+if(I(VS_GPU_2)>1m,1,0)+if(I(VS_GPU_3)>1m,1,0)+if(I(VS_GPU_4)>1m,1,0)+if(I(VS_GPU_5)>1m,1,0)+if(I(VS_GPU_6)>1m,1,0)+if(I(VS_GPU_7)>1m,1,0)+if(I(VS_GPU_8)>1m,1,0)+if(I(VS_GPU_9)>1m,1,0)+if(I(VS_GPU_10)>1m,1,0)) AT=350m
.meas tran GPU_RESET FIND (if(I(VS_GPU_1)>1m,1,0)+if(I(VS_GPU_2)>1m,1,0)+if(I(VS_GPU_3)>1m,1,0)+if(I(VS_GPU_4)>1m,1,0)+if(I(VS_GPU_5)>1m,1,0)+if(I(VS_GPU_6)>1m,1,0)+if(I(VS_GPU_7)>1m,1,0)+if(I(VS_GPU_8)>1m,1,0)+if(I(VS_GPU_9)>1m,1,0)+if(I(VS_GPU_10)>1m,1,0)) AT=750m
.meas tran GPU_I AVG I(VS_GPU_1) FROM 330m TO 350m
.meas tran GPU_P AVG (V(K_GPU_1_SINK)*I(VS_GPU_1)+V(K_GPU_2_SINK)*I(VS_GPU_2)+V(K_GPU_3_SINK)*I(VS_GPU_3)+V(K_GPU_4_SINK)*I(VS_GPU_4)+V(K_GPU_5_SINK)*I(VS_GPU_5)+V(K_GPU_6_SINK)*I(VS_GPU_6)+V(K_GPU_7_SINK)*I(VS_GPU_7)+V(K_GPU_8_SINK)*I(VS_GPU_8)+V(K_GPU_9_SINK)*I(VS_GPU_9)+V(K_GPU_10_SINK)*I(VS_GPU_10)+V(VCC_GPU)*I(VLOGIC_GPU)) FROM 330m TO 350m
.meas tran GPU_START FIND (if(I(VS_GPU_1)>1m,1,0)+if(I(VS_GPU_2)>1m,1,0)+if(I(VS_GPU_3)>1m,1,0)+if(I(VS_GPU_4)>1m,1,0)+if(I(VS_GPU_5)>1m,1,0)+if(I(VS_GPU_6)>1m,1,0)+if(I(VS_GPU_7)>1m,1,0)+if(I(VS_GPU_8)>1m,1,0)+if(I(VS_GPU_9)>1m,1,0)+if(I(VS_GPU_10)>1m,1,0)) AT=50m
.meas tran NPU_SIG AVG V(SIG_NPU) FROM 330m TO 350m
.meas tran NPU_RIPPLE PP V(SIG_NPU) FROM 330m TO 350m
.meas tran NPU_COUNT FIND (if(I(VS_NPU_1)>1m,1,0)+if(I(VS_NPU_2)>1m,1,0)+if(I(VS_NPU_3)>1m,1,0)+if(I(VS_NPU_4)>1m,1,0)+if(I(VS_NPU_5)>1m,1,0)+if(I(VS_NPU_6)>1m,1,0)+if(I(VS_NPU_7)>1m,1,0)+if(I(VS_NPU_8)>1m,1,0)+if(I(VS_NPU_9)>1m,1,0)+if(I(VS_NPU_10)>1m,1,0)) AT=350m
.meas tran NPU_RESET FIND (if(I(VS_NPU_1)>1m,1,0)+if(I(VS_NPU_2)>1m,1,0)+if(I(VS_NPU_3)>1m,1,0)+if(I(VS_NPU_4)>1m,1,0)+if(I(VS_NPU_5)>1m,1,0)+if(I(VS_NPU_6)>1m,1,0)+if(I(VS_NPU_7)>1m,1,0)+if(I(VS_NPU_8)>1m,1,0)+if(I(VS_NPU_9)>1m,1,0)+if(I(VS_NPU_10)>1m,1,0)) AT=750m
.meas tran NPU_I AVG I(VS_NPU_1) FROM 330m TO 350m
.meas tran NPU_P AVG (V(K_NPU_1_SINK)*I(VS_NPU_1)+V(K_NPU_2_SINK)*I(VS_NPU_2)+V(K_NPU_3_SINK)*I(VS_NPU_3)+V(K_NPU_4_SINK)*I(VS_NPU_4)+V(K_NPU_5_SINK)*I(VS_NPU_5)+V(K_NPU_6_SINK)*I(VS_NPU_6)+V(K_NPU_7_SINK)*I(VS_NPU_7)+V(K_NPU_8_SINK)*I(VS_NPU_8)+V(K_NPU_9_SINK)*I(VS_NPU_9)+V(K_NPU_10_SINK)*I(VS_NPU_10)+V(VCC_NPU)*I(VLOGIC_NPU)) FROM 330m TO 350m
.meas tran NPU_START FIND (if(I(VS_NPU_1)>1m,1,0)+if(I(VS_NPU_2)>1m,1,0)+if(I(VS_NPU_3)>1m,1,0)+if(I(VS_NPU_4)>1m,1,0)+if(I(VS_NPU_5)>1m,1,0)+if(I(VS_NPU_6)>1m,1,0)+if(I(VS_NPU_7)>1m,1,0)+if(I(VS_NPU_8)>1m,1,0)+if(I(VS_NPU_9)>1m,1,0)+if(I(VS_NPU_10)>1m,1,0)) AT=50m
.meas tran SUPPLY_MIN MIN V(5V) FROM 0 TO 800m
.backanno
.end